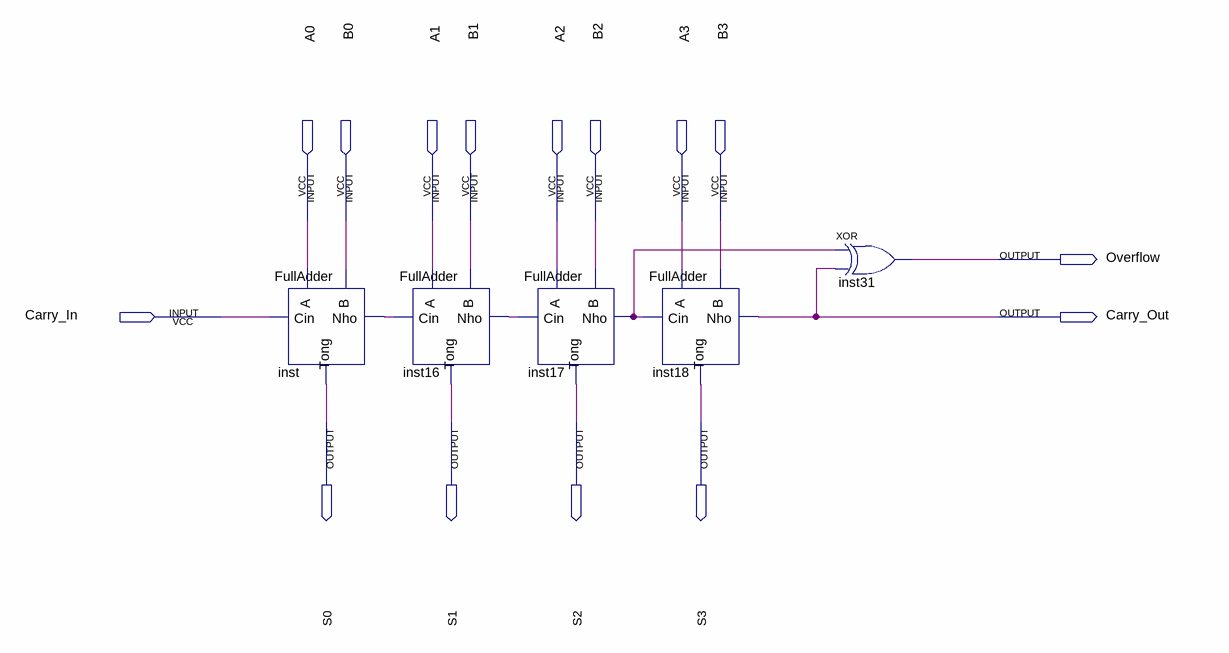
[diagram p0: schematic sheet]
// Quartus schematic FA_4bit.bdf as structural Verilog: 5 symbols, 15 pins
module FA_4bit (
  input  A0,
  input  B0,
  input  A1,
  input  B1,
  input  A2,
  input  B2,
  input  A3,
  input  B3,
  input  Carry_In,
  output Overflow,
  output Carry_Out,
  output S0,
  output S1,
  output S2,
  output S3
);

  wire inst16_nho, inst17_nho, inst_nho;

  FullAdder inst (.Cin(Carry_In), .A(A0), .B(B0), .Tong(S0), .Nho(inst_nho));
  FullAdder inst16 (.Cin(inst_nho), .A(A1), .B(B1), .Tong(S1), .Nho(inst16_nho));
  FullAdder inst17 (.Cin(inst16_nho), .A(A2), .B(B2), .Tong(S2), .Nho(inst17_nho));
  FullAdder inst18 (.Cin(inst17_nho), .A(A3), .B(B3), .Tong(S3), .Nho(Carry_Out));
  xor inst31 (Overflow, inst17_nho, Carry_Out);
endmodule
